# EasyEDA Pro project Arctos.eprj, board PCB1
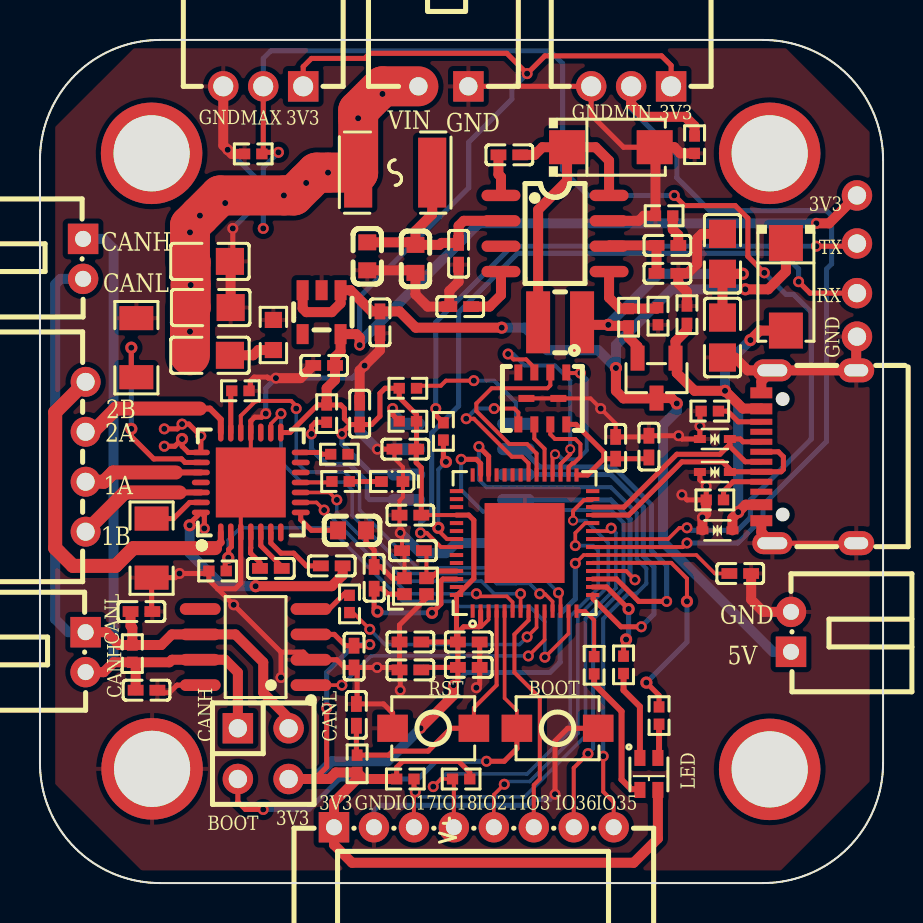
[diagram p1: board, top side]
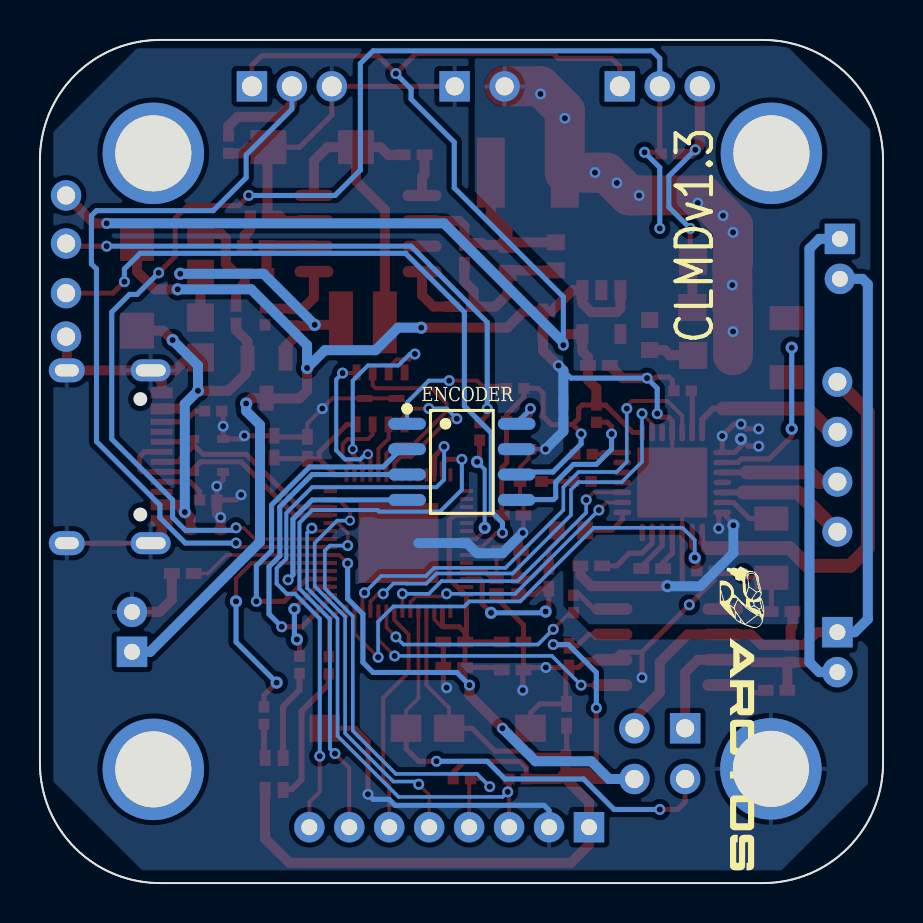
[diagram p2: board, bottom side, seen from below]

Outline 42.2 x 42.2 mm; copper layers: Top Layer, Bottom Layer. Coordinates in mm from the lower left corner of the outline.
Outline path: 0,36.2 0,36.3 0,36.39 0.01,36.49 0.01,36.59 0.02,36.68 0.03,36.78 0.04,36.88 0.05,36.97 0.06,37.07 0.08,37.16 0.09,37.26 0.11,37.35 0.13,37.45 0.15,37.54 0.17,37.63 0.2,37.73 0.22,37.82 0.25,37.91 0.28,38 0.31,38.09 0.34,38.18 0.37,38.27 0.4,38.36 0.44,38.45 0.48,38.54 0.51,38.63 0.55,38.71 0.59,38.8 0.64,38.89 0.68,38.97 0.72,39.06 0.77,39.14 0.82,39.22 0.87,39.31 0.92,39.39 0.97,39.47 1.02,39.55 1.08,39.63 1.13,39.71 1.19,39.78 1.25,39.86 1.31,39.94 1.37,40.01 1.43,40.09 1.49,40.16 1.56,40.23 1.62,40.3 1.69,40.37 1.76,40.44 1.83,40.51 1.9,40.58 1.97,40.64 2.04,40.71 2.11,40.77 2.19,40.83 2.26,40.89 2.34,40.95 2.42,41.01 2.49,41.07 2.57,41.12 2.65,41.18 2.73,41.23 2.81,41.28 2.89,41.33 2.98,41.38 3.06,41.43 3.14,41.48 3.23,41.52 3.31,41.56 3.4,41.61 3.49,41.65 3.57,41.69 3.66,41.72 3.75,41.76 3.84,41.8 3.93,41.83 4.02,41.86 4.11,41.89 4.2,41.92 4.29,41.95 4.38,41.98 4.47,42 4.57,42.03 4.66,42.05 4.75,42.07 4.85,42.09 4.94,42.11 5.04,42.12 5.13,42.14 5.23,42.15 5.32,42.16 5.42,42.17 5.52,42.18 5.61,42.19 5.71,42.19 5.81,42.2 5.9,42.2 6,42.2 36.2,42.2 36.3,42.2 36.39,42.2 36.49,42.19 36.59,42.19 36.68,42.18 36.78,42.17 36.88,42.16 36.97,42.15 37.07,42.14 37.16,42.12 37.26,42.11 37.35,42.09 37.45,42.07 37.54,42.05 37.63,42.03 37.73,42 37.82,41.98 37.91,41.95 38,41.92 38.09,41.89 38.18,41.86 38.27,41.83 38.36,41.8 38.45,41.76 38.54,41.72 38.63,41.69 38.71,41.65 38.8,41.61 38.89,41.56 38.97,41.52 39.06,41.48 39.14,41.43 39.22,41.38 39.31,41.33 39.39,41.28 39.47,41.23 39.55,41.18 39.63,41.12 39.71,41.07 39.78,41.01 39.86,40.95 39.94,40.89 40.01,40.83 40.09,40.77 40.16,40.71 40.23,40.64 40.3,40.58 40.37,40.51 40.44,40.44 40.51,40.37 40.58,40.3 40.64,40.23 40.71,40.16 40.77,40.09 40.83,40.01 40.89,39.94 40.95,39.86 41.01,39.78 41.07,39.71 41.12,39.63 41.18,39.55 41.23,39.47 41.28,39.39 41.33,39.31 41.38,39.22 41.43,39.14 41.48,39.06 41.52,38.97 41.56,38.89 41.61,38.8 41.65,38.71 41.69,38.63 41.72,38.54 41.76,38.45 41.8,38.36 41.83,38.27 41.86,38.18 41.89,38.09 41.92,38 41.95,37.91 41.98,37.82 42,37.73 42.03,37.63 42.05,37.54 42.07,37.45 42.09,37.35 42.11,37.26 42.12,37.16 42.14,37.07 42.15,36.97 42.16,36.88 42.17,36.78 42.18,36.68 42.19,36.59 42.19,36.49 42.2,36.39 42.2,36.3 42.2,36.2 42.2,6 42.2,5.9 42.2,5.81 42.19,5.71 42.19,5.61 42.18,5.52 42.17,5.42 42.16,5.32 42.15,5.23 42.14,5.13 42.12,5.04 42.11,4.94 42.09,4.85 42.07,4.75 42.05,4.66 42.03,4.57 42,4.47 41.98,4.38 41.95,4.29 41.92,4.2 41.89,4.11 41.86,4.02 41.83,3.93 41.8,3.84 41.76,3.75 41.72,3.66 41.69,3.57 41.65,3.48 41.61,3.4 41.56,3.31 41.52,3.23 41.48,3.14 41.43,3.06 41.38,2.98 41.33,2.89 41.28,2.81 41.23,2.73 41.18,2.65 41.12,2.57 41.07,2.49 41.01,2.42 40.95,2.34 40.89,2.26 40.83,2.19 40.77,2.11 40.71,2.04 40.64,1.97 40.58,1.9 40.51,1.83 40.44,1.76 40.37,1.69 40.3,1.62 40.23,1.56 40.16,1.49 40.09,1.43 40.01,1.37 39.94,1.31 39.86,1.25 39.78,1.19 39.71,1.13 39.63,1.08 39.55,1.02 39.47,0.97 39.39,0.92 39.31,0.87 39.22,0.82 39.14,0.77 39.06,0.72 38.97,0.68 38.89,0.64 38.8,0.59 38.71,0.55 38.63,0.51 38.54,0.48 38.45,0.44 38.36,0.4 38.27,0.37 38.18,0.34 38.09,0.31 38,0.28 37.91,0.25 37.82,0.22 37.73,0.2 37.63,0.17 37.54,0.15 37.45,0.13 37.35,0.11 37.26,0.09 37.16,0.08 37.07,0.06 36.97,0.05 36.88,0.04 36.78,0.03 36.68,0.02 36.59,0.01 36.49,0.01 36.39,0 36.3,0 36.2,0 6,0 5.9,0 5.81,0 5.71,0.01 5.61,0.01 5.52,0.02 5.42,0.03 5.32,0.04 5.23,0.05 5.13,0.06 5.04,0.08 4.94,0.09 4.85,0.11 4.75,0.13 4.66,0.15 4.57,0.17 4.47,0.2 4.38,0.22 4.29,0.25 4.2,0.28 4.11,0.31 4.02,0.34 3.93,0.37 3.84,0.4 3.75,0.44 3.66,0.48 3.57,0.51 3.49,0.55 3.4,0.59 3.31,0.64 3.23,0.68 3.14,0.72 3.06,0.77 2.98,0.82 2.89,0.87 2.81,0.92 2.73,0.97 2.65,1.02 2.57,1.08 2.49,1.13 2.42,1.19 2.34,1.25 2.26,1.31 2.19,1.37 2.11,1.43 2.04,1.49 1.97,1.56 1.9,1.62 1.83,1.69 1.76,1.76 1.69,1.83 1.62,1.9 1.56,1.97 1.49,2.04 1.43,2.11 1.37,2.19 1.31,2.26 1.25,2.34 1.19,2.42 1.13,2.49 1.08,2.57 1.02,2.65 0.97,2.73 0.92,2.81 0.87,2.89 0.82,2.98 0.77,3.06 0.72,3.14 0.68,3.23 0.64,3.31 0.59,3.4 0.55,3.48 0.51,3.57 0.48,3.66 0.44,3.75 0.4,3.84 0.37,3.93 0.34,4.02 0.31,4.11 0.28,4.2 0.25,4.29 0.22,4.38 0.2,4.47 0.17,4.57 0.15,4.66 0.13,4.75 0.11,4.85 0.09,4.94 0.08,5.04 0.06,5.13 0.05,5.23 0.04,5.32 0.03,5.42 0.02,5.52 0.01,5.61 0.01,5.71 0,5.81 0,5.9 0,6 0,36.2
Stack: Top Layer 0.035mm / Dielectric1 1.51mm FR4 er 4.5 / Bottom Layer 0.035mm

## Design rules (mm)
template: Custom Config
spacing copperThickness1oz (default): track to track 0.102, other pairs 0.152 to 0.3
spacing copperThickness2oz: track to track 0.203, other pairs 0.152 to 0.3
track width copperThickness1oz (default): min 0.127, default 0.254, max 2.54
track width copperThickness2oz: min 1.2, default 1.27, max 1.3
differential pair differentialPair (default): width min 0.127, default 0.254, max 2.54; gap min 0.152, default 0.152
via viaSize (default): diameter min 0.5, default 0.55, max 10; hole min 0.3, default 0.305, max 6.3
net CANL uses copperThickness2oz
net CANH uses copperThickness2oz
net +3.3V uses copperThickness2oz
net GND uses copperThickness2oz
net +24V uses copperThickness2oz
net 1B uses copperThickness2oz
net 1A uses copperThickness2oz
net 2A uses copperThickness2oz
net 2B uses copperThickness2oz
net +5V uses copperThickness2oz
net $1N9271 uses copperThickness2oz
net J_MIN uses copperThickness2oz
net J_MAX uses copperThickness2oz
net BOOT uses copperThickness2oz

## Placement (name value [footprint] x y rotation side)
C1  100nF  [C0402]  23.49 36.45 0 top
C2  33uF  [C0805]  34.16 31.5 270 top
C3  33uF  [C0805]  34.16 27.31 90 top
C4  4.7uF  [C0603]  16.38 31.37 270 top
C5  4.7uF  [C0603]  18.8 31.24 270 top
C6  10nF  [C0402]  20.95 31.5 90 top
C7  10nF  [C0402]  21.03 28.85 0 top
C8  1nF  [C0402]  31.41 31.91 180 top
C9  47pF  [C0402]  31.41 30.52 180 top
C10  1uF  [C0402]  17.02 28.07 90 top
C11  1uF  [C0402]  18.29 21.72 0 top
C12  30pF  [C0402]  5.08 13.59 180 top
C13  30pF  [C0402]  5.33 9.65 180 top
C14  100nF  [C0402]  15.72 11.34 90 top
C15  100nF  [C0402]  14.6 15.88 180 top
C16  10uF  [C0402]  18.54 18.42 0 top
C17  1uF  [C0805]  8.51 26.42 180 top
C18  1uF  [C0402]  35.05 15.49 180 top
C19  100nF  [C0402]  18.54 10.67 0 top
C20  100nF  [C0402]  18.54 12.06 0 top
C21  10uF  [C0805]  8.54 28.81 180 top
C22  10uF  [C0805]  8.51 31.12 180 top
C23  22nF  [C0402]  11.56 15.75 180 top
C24  12pF  [C0402]  16.73 15.28 270 top
C25  12pF  [C0402]  18.67 16.64 0 top
C26  1uF  [C0402]  16 23.5 270 top
C27  1uF  [C0402]  21.46 10.8 180 top
C28  100nF  [C0402]  21.46 12.06 180 top
C29  4.7uF  [C0603]  15.62 17.65 0 top
C30  1uF  [C0402]  28.82 21.78 270 top
C31  100nF  [C0402]  30.48 21.84 270 top
C32  100nF  [C0402]  14.22 25.91 0 top
C33  100nF  [C0402]  15.84 8.42 270 top
CN1  JS20T-S03PHW-00  [CONN-TH_3P-P2.00_HC-PH-3AW-G]  29.59 39.88 180 top
CN2  JS20T-S03PHW-00  [CONN-TH_3P-P2.00_HC-PH-3AW-G]  11.18 39.88 180 top
D1  B340A-13-F  [SMA_L4.4-W2.6-LS5.0-RD]  28.57 36.83 0 top
D2  B340A-13-F  [SMA_L4.4-W2.6-LS5.0-RD]  37.34 29.84 270 top
F1  BSMD1812-200-30V  [F1812]  17.78 35.56 0 top
L1  6.8uH  [IND-SMD_L3.0-W3.0_FTC303020D]  26.03 28.07 0 top
LED1  19-237/R6GHBHC-A07/2T  [LED-ARRAY-SMD_4P-L1.6-W1.6-BL-CW]  30.48 5.46 270 top
NOREF  -  [Pad_e36902]  5.61 5.72 0 top
NOREF#2  -  [Pad_e36899]  36.52 36.53 0 top
NOREF#3  -  [Pad_e36903]  36.52 5.69 0 top
NOREF#4  -  [Pad_e168]  40.89 32.01 0 top
NOREF#5  -  [Pad_e36901]  5.59 36.53 0 top
NOREF#6  -  [Pad_e170]  40.89 27.35 0 top
NOREF#7  -  [Pad_e167]  40.89 34.42 0 top
NOREF#8  -  [Pad_e169]  40.89 29.53 0 top
P1  2.54-2*2P针  [HDR-TH_4P-P2.54-V-M-R2-C2-S2.54-1]  11.18 6.48 270 top
Q1  DMG2305UX-7  [SOT-23-3_L2.9-W1.3-P1.90-LS2.4-BR]  30.86 25.27 90 top
R1  10kΩ  [R0402]  29.46 28.32 270 top
R2  1.91kΩ  [R0402]  30.94 28.37 90 top
R3  100kΩ  [R0402]  32.38 28.45 270 top
R4  5.1kΩ  [R0402]  33.53 23.62 0 top
R5  5.1kΩ  [R0402]  33.78 19.18 0 top
R6  29.4kΩ  [R0402]  31.24 33.4 0 top
R7  330Ω  [R0402]  29.21 10.92 90 top
R8  120Ω  [R0402]  4.62 11.48 270 top
R9  10kΩ  [R0402]  18.29 5.21 180 top
R10  10kΩ  [R0402]  21.08 5.21 0 top
R11  330Ω  [R0402]  27.74 10.9 90 top
R12  4.7kΩ  [R0402]  15.49 13.97 90 top
R13  330Ω  [R0402]  30.99 8.38 90 top
R14  100kΩ  [R0402]  8.89 15.62 180 top
R15  1.1Ω  [R0603]  11.68 27.43 270 top
R16  499Ω  [R0402]  20.19 22.61 90 top
R17  4.7kΩ  [R0402]  18.41 24.77 180 top
R18  4.7kΩ  [R0402]  18.41 23.11 0 top
R19  4.7kΩ  [R0402]  14.35 23.5 90 top
R20  1kΩ  [R0402]  14.99 21.46 180 top
R21  330Ω  [R0402]  15.05 20.1 180 top
R22  120mΩ  [R1206]  5.59 16.76 90 top
R23  120mΩ  [R1206]  4.83 26.8 270 top
R24  100kΩ  [R0402]  10.03 24.64 180 top
R25  10kΩ  [R0402]  15.87 5.97 270 top
R26  10kΩ  [R0402]  32.77 36.96 90 top
R27  10kΩ  [R0402]  10.67 36.5 0 top
SW1  HX 3x4x2-2P-2.5N  [SW-SMD_L4.0-W2.9-LS5.0]  25.91 7.75 0 top
SW2  HX 3x4x2-2P-2.5N  [SW-SMD_L4.0-W2.9-LS5.0]  19.68 7.75 180 top
U1  TPS54331DR  [SOIC-8_L5.0-W4.0-P1.27-LS6.0-BL]  25.78 32.51 270 top
U2  BX-XH2.54-2PWZ  [CONN-TH_2P-P2.50_BX-XH2.54-2PWZ]  20.19 39.88 180 top
U3  LESD5Z5.0CT1G  [SOD-523_L1.2-W0.8-LS1.6-BI]  33.78 20.57 0 top
U4  LESD5Z5.0CT1G  [SOD-523_L1.2-W0.8-LS1.6-BI]  33.78 22.23 0 top
U5  LESD5Z5.0CT1G  [SOD-523_L1.2-W0.8-LS1.6-BI]  33.91 17.65 0 top
U6  TLV75733PDBVR  [SOT-23-5_L2.9-W1.6-P0.95-LS2.8-BL]  14.1 28.58 180 top
U7  TJA1050T-JSM  [SOIC-8_L4.9-W3.9-P1.27-LS6.0-BL]  10.79 11.81 90 top
U8  JS20T-S02PHW-00  [CONN-TH_JS20T-S02PHW-00]  2.16 31.24 270 top
U9  JS20T-S02PHW-00  [CONN-TH_JS20T-S02PHW-00]  2.29 11.56 270 top
U10  JS20T-S08PHW-00  [CONN-TH_8P-P2.00_JS20T-S08PHW]  21.72 2.79 0 top
U11  ESP32-S3R8  [QFN-56_L7.0-W7.0-P0.40-TL-EP4.0]  24.26 17.02 90 top
U12  TMC2209-LA-T  [QFN-28_L5.0-W5.0-P0.50-BL-EP]  10.55 20.05 0 top
U13  TLE5012BE1000  [PG-DSO-8_L5.0-W4.0-P1.27-LS6.0-BL]  21.08 21.08 270 bottom
U14  XL-1005UWC  [LED0402-RD_YELLOW]  17.63 20.1 180 top
U15  W25Q16JVUUIQ  [USON-8_L4.0-W3.0-P0.80-BL_AT25SL321]  25.15 24.26 180 top
U16  XY-XHB2.54-4A21  [HDR-TH_4P-P2.50-H-F-W7.3-N]  2.29 21.34 270 top
U17  JS20T-S02PHW-00  [CONN-TH_JS20T-S02PHW-00]  37.59 12.57 90 top
USB1  TYPE-C 16PIN 2MD(073)  [USB-C-SMD_TYPE-C-6PIN-2MD-073]  38.48 21.34 90 top
X1  40MHz  [CRYSTAL-SMD_4P-L1.6-W1.2-BL]  18.8 14.86 0 top

## Footprints (pads in the part's own frame, mm; a bottom-side part is the same pattern mirrored in y, then rotated)
C0402
  rect 0.79x0.54 smd: 1(-0.545,0) 2(0.545,0)
C0603
  rect 0.8x0.9 smd: 1(-0.7,0) 2(0.7,0)
C0805
  rect 1.41x1.35 smd: 1(-1,0) 2(1,0)
CONN-TH_2P-P2.50_BX-XH2.54-2PWZ
  rect 1.524x1.524 hole 0.914: 1(-1.25,0)
  round 1.524 hole 0.914: 2(1.25,0)
CONN-TH_3P-P2.00_HC-PH-3AW-G
  rect 1.524x1.524 hole 1: 1(-2,0)
  round 1.524 hole 1: 2(0,0) 3(2,0)
CONN-TH_8P-P2.00_JS20T-S08PHW
  rect 1.524x1.524 hole 0.8: 1(-7,0)
  round 1.524 hole 0.8: 2(-5,0) 3(-3,0) 4(-1,0) 5(1,0) 6(3,0) 7(5,0) 8(7,0)
CONN-TH_JS20T-S02PHW-00
  rect 1.524x1.524 hole 0.8: 1(-1,0)
  round 1.524 hole 0.8: 2(1,0)
CRYSTAL-SMD_4P-L1.6-W1.2-BL
  rect 0.73x0.6 smd: 1(-0.55,-0.4) 2(0.55,-0.4) 3(0.55,0.4) 4(-0.55,0.4)
F1812
  rect 1.407x3.499 smd: 1(-1.853,0) 2(1.853,0)
HDR-TH_4P-P2.50-H-F-W7.3-N
  round 1.5 hole 0.9: 1(-3.75,0) 2(-1.25,0) 3(1.25,0) 4(3.75,0)
HDR-TH_4P-P2.54-V-M-R2-C2-S2.54-1
  rect 1.524x1.524 hole 0.914: 1(-1.27,-1.27)
  round 1.524 hole 0.914: 2(-1.27,1.27) 3(1.27,-1.27) 4(1.27,1.27)
IND-SMD_L3.0-W3.0_FTC303020D
  rect 1.2x3.1 smd: 1(-1.1,0) 2(1.1,0)
LED0402-RD_YELLOW
  rect 0.636x0.54 smd: 1(-0.538,0) 2(0.538,0)
LED-ARRAY-SMD_4P-L1.6-W1.6-BL-CW
  rect 0.8x0.55 smd: 1(-0.8,-0.45) 2(0.8,-0.45) 3(-0.8,0.45) 4(0.8,0.45)
Pad_e167
  round 1.524 hole 0.914: 1(0,0)
Pad_e168
  round 1.524 hole 0.914: 2(0,0)
Pad_e169
  round 1.524 hole 0.914: 3(0,0)
Pad_e170
  round 1.524 hole 0.914: 4(0,0)
Pad_e36899
  round 5.08 hole 3.81: 1(0,0)
Pad_e36901
  round 5.08 hole 3.81: 1(0,0)
Pad_e36902
  round 5.08 hole 3.81: 1(0,0)
Pad_e36903
  round 5.08 hole 3.81: 1(0,0)
PG-DSO-8_L5.0-W4.0-P1.27-LS6.0-BL
  oval 0.602x1.885 smd: 1(-1.905,-2.743) 2(-0.635,-2.743) 3(0.635,-2.743) 4(1.905,-2.743) 5(1.905,2.743) 6(0.635,2.743) 7(-0.635,2.743) 8(-1.905,2.743)
QFN-28_L5.0-W5.0-P0.50-BL-EP
  oval 0.28x0.9 smd: 1(-1.502,-2.5) 2(-1.001,-2.5) 3(-0.5,-2.5) 4(0,-2.5) 5(0.5,-2.5) 6(1,-2.5) 7(1.501,-2.5) 15(1.501,2.5) 16(1,2.5) 17(0.5,2.5) 18(0,2.5) 19(-0.5,2.5) 20(-1.001,2.5) 21(-1.502,2.5)
  oval 0.9x0.28 smd: 8(2.5,-1.502) 9(2.5,-1.001) 10(2.5,-0.5) 11(2.5,0) 12(2.5,0.5) 13(2.5,1) 14(2.5,1.501) 22(-2.5,1.501) 23(-2.5,1) 24(-2.5,0.5) 25(-2.5,0) 26(-2.5,-0.5) 27(-2.5,-1.001) 28(-2.5,-1.502)
  rect 3.5x3.5 smd: 29(0,0)
QFN-56_L7.0-W7.0-P0.40-TL-EP4.0
  rect 0.665x0.2 smd: 1(-3.408,2.6) 2(-3.408,2.2) 3(-3.408,1.8) 4(-3.408,1.4) 5(-3.408,1) 6(-3.408,0.6) 7(-3.408,0.2) 8(-3.408,-0.2) 9(-3.408,-0.6) 10(-3.408,-1) 11(-3.408,-1.4) 12(-3.408,-1.8) 13(-3.408,-2.2) 14(-3.408,-2.6) 29(3.408,-2.6) 30(3.408,-2.2) 31(3.408,-1.8) 32(3.408,-1.4) 33(3.408,-1) 34(3.408,-0.6) 35(3.408,-0.2) 36(3.408,0.2) 37(3.408,0.6) 38(3.408,1) 39(3.408,1.4) 40(3.408,1.8) 41(3.408,2.2) 42(3.408,2.6)
  rect 0.2x0.665 smd: 15(-2.6,-3.408) 16(-2.2,-3.408) 17(-1.8,-3.408) 18(-1.4,-3.408) 19(-1,-3.408) 20(-0.6,-3.408) 21(-0.2,-3.408) 22(0.2,-3.408) 23(0.6,-3.408) 24(1,-3.408) 25(1.4,-3.408) 26(1.8,-3.408) 27(2.2,-3.408) 28(2.6,-3.408) 43(2.6,3.408) 44(2.2,3.408) 45(1.8,3.408) 46(1.4,3.408) 47(1,3.408) 48(0.6,3.408) 49(0.2,3.408) 50(-0.2,3.408) 51(-0.6,3.408) 52(-1,3.408) 53(-1.4,3.408) 54(-1.8,3.408) 55(-2.2,3.408) 56(-2.6,3.408)
  rect 4x4 smd: 57(0,0)
R0402
  rect 0.566x0.54 smd: 1(-0.433,0) 2(0.433,0)
R0603
  rect 0.806x0.864 smd: 1(-0.753,0) 2(0.753,0)
R1206
  rect 1.208x1.701 smd: 1(-1.479,0) 2(1.479,0)
SMA_L4.4-W2.6-LS5.0-RD
  rect 1.8x1.7 smd: 1(-2.192,0) 2(2.192,0)
SOD-523_L1.2-W0.8-LS1.6-BI
  rect 0.6x0.4 smd: 1(-0.75,0) 2(0.75,0)
SOIC-8_L4.9-W3.9-P1.27-LS6.0-BL
  oval 0.588x2.045 smd: 1(-1.905,-2.772) 2(-0.635,-2.772) 3(0.635,-2.772) 4(1.905,-2.772) 5(1.905,2.772) 6(0.635,2.772) 7(-0.635,2.772) 8(-1.905,2.772)
SOIC-8_L5.0-W4.0-P1.27-LS6.0-BL
  oval 0.569x1.95 smd: 1(-1.905,-2.705) 2(-0.635,-2.705) 3(0.635,-2.705) 4(1.905,-2.705) 5(1.905,2.705) 6(0.635,2.705) 7(-0.635,2.705) 8(-1.905,2.705)
SOT-23-3_L2.9-W1.3-P1.90-LS2.4-BR
  rect 1.25x0.7 smd: 1(1,-0.95) 2(1,0.95) 3(-1,0)
SOT-23-5_L2.9-W1.6-P0.95-LS2.8-BL
  rect 0.6x1 smd: 1(-0.95,-1.1) 2(0,-1.1) 3(0.95,-1.1) 4(0.95,1.1) 5(-0.95,1.1)
SW-SMD_L4.0-W2.9-LS5.0
  rect 1.53x1.36 smd: 1(-2.035,0) 2(2.035,0)
USB-C-SMD_TYPE-C-6PIN-2MD-073
  rect 0.55x1.1 smd: 1(-3.2,2.375) 2(-2.4,2.375) 11(2.4,2.375) 12(3.2,2.375)
  rect 0.3x1.1 smd: 3(-1.75,2.375) 4(-1.25,2.375) 5(-0.75,2.375) 6(-0.25,2.375) 7(0.25,2.375) 8(0.75,2.375) 9(1.25,2.375) 10(1.75,2.375)
  oval 1.1x2 hole 0.6x1.5: 13(-4.325,1.825) 14(4.325,1.825)
  oval 1.2x1.8 hole 0.6x1.2: 13(-4.325,-2.375) 14(4.325,-2.375)
USON-8_L4.0-W3.0-P0.80-BL_AT25SL321
  rect 0.4x0.8 smd: 1(-1.2,-1.3) 2(-0.4,-1.3) 3(0.4,-1.3) 4(1.2,-1.3) 5(1.2,1.3) 6(0.4,1.3) 7(-0.4,1.3) 8(-1.2,1.3)
  rect 0.8x0.35 smd: 9(-0.802,0) 10(0.798,0)

## Nets
As in the schematic, except:
+3.3V: C11.2 C14.2 C16.2 C18.2 C19.2 C20.2 C26.2 C27.2 C28.2 C32.2 CN1.1 CN2.1 LED1.4 NOREF#7.1 P1.4 R9.2 R10.2 R17.2 R18.2 R19.2 R25.2 U6.5 U7.3 U10.1 U11.2 U11.3 U11.20 U11.46 U11.55 U11.56 U12.15 U13.6
GND: C2.1 C3.1 C4.2 C5.2 C6.1 C7.1 C9.1 C10.1 C11.1 C12.1 C13.1 C14.1 C16.1 C18.1 C19.1 C20.1 C21.1 C22.1 C24.1 C25.1 C26.1 C27.1 C28.1 C29.2 C30.1 C31.1 C32.1 C33.1 CN1.3 CN2.3 D1.2 NOREF.1 NOREF#6.4 R2.1 R3.1 R4.1 R5.1 R6.1 R14.2 R15.1 R22.1 R23.1 R24.1 R26.1 R27.1 SW1.2 SW2.2 U1.7 U2.1 U3.1 U4.1 U5.1 U6.2 U7.2 U7.8 U10.2 U11.57 U12.3 U12.18 U12.29 U13.7 U14.1 U15.4 U15.9 U15.10 U17.2 USB1.1 USB1.12 USB1.13 USB1.14 X1.2 X1.4
U0RXD: NOREF#8.3 U11.50
U0TXD: NOREF#4.2 R16.2

Pads without a net: NOREF#2 1; NOREF#5 1; U1 3; U6 4; U7 5; U11 1 28 36 37 42 43 44 45 47 48 51 52; U12 17 25; USB1 3 9

## Via types
v1: diameter 0.55, hole 0.305, Top Layer to Bottom Layer, 88 vias
v2: diameter 0.61, hole 0.305, Top Layer to Bottom Layer, 23 vias
v3: diameter 0.5, hole 0.305, Top Layer to Bottom Layer, 3 vias

## Routing (per net, layer and track width the routed paths; a pad name or vN(x,y) marks a point on that pad's centre or on a via; arc(x,y) is an arc through that point)
5V_OUT: length 2.4
  Top Layer w0.254: C29.1 13.59,17.65 13.05,18.19 U12.8
+3.3V: length 186.6
  Top Layer w0.18: C18.2 33.78,15.49 32.86,16.42 U11.20 27.21,16.42 v1(26.8,16) ; 21.97,12.83 22.1,12.83 22.46,13.19 U11.3
  Top Layer w0.2: U11.46 19.09,18.42 C16.2
  Top Layer w0.254: U11.46 21.46,18.42 21.72,18.16 21.72,15.24 20.89,14.42 U11.56 20.85,12.13 C28.2 ; C28.2 C27.2 ; C28.2 C20.2 ; C28.2 20.92,12.54 21.21,12.83 21.97,12.83 22.06,12.91 22.06,13.61 ; R9.2 17.85,5.79 18.16,6.1 20.95,6.1 21.51,5.54 R10.2 ; 15.53,22.95 15.11,22.53 v1(15.11,22.48) ; 15.53,22.95 C26.2 16.6,22.95 17.02,23.37 17.02,24.51 17.27,24.77 R17.2 17.98,24.31 18.85,23.44 R18.2 18.85,21.73 C11.2 18.83,21.05 19.09,20.79 C16.2 ; 15.53,22.95 15.24,23.24 15.24,23.75 15.06,23.93 R19.2 13.89,23.93 12.52,22.55 U12.15 ; C27.2 19.21,10.8 C19.2 ; C27.2 20.92,10.12 v1(20.7,9.91) ; U7.3 14.73,12.45 15.3,11.88 C14.2 16.45,11.88 v1(16.51,11.94) ; CN1.1 31.59,40.93 31.11,41.4 25.27,41.4 v1(24.38,40.51) 23.37,41.53 16.51,41.53 16.26,41.28 13.59,41.28 13.18,40.86 CN2.1 ; 13.75,5.21 14.35,5.81 v1(14.35,8.76)
  Top Layer w0.5: R25.2 15.87,5.21 14.72,4.05 U10.1 14.72,1.92 15.62,1.02 29.72,1.02 30.93,2.23 LED1.4 ; R25.2 16.2,5.21 R9.2 ; R25.2 14.81,5.54 14.48,5.21 P1.4 ; v1(38.86,33.02) 39.5,33.02 NOREF#7.1 ; v1(20.7,9.91) 20.7,9.4 v1(19.05,7.75) ; v1(16,26.92) 16,27.31 15.83,27.48 15.05,27.48 15.05,26.6 14.77,26.33 C32.2 14.77,25.18 14.35,24.77 R19.2
  Bottom Layer w0.254: v1(20.7,9.91) 21.34,10.54 25.53,10.54 26.03,11.05 26.03,13.46 26.8,14.22 v1(26.8,16) ; 16,27.05 16,29.34 21.46,34.8 21.46,37.08 23.62,39.24 23.62,39.75 v1(24.38,40.51) ; v1(15.11,22.48) 15.11,21.98 16.52,20.57 18.25,20.57 18.36,20.46 ; v1(14.35,8.76) 14.35,10.54 15.75,11.94 v1(16.51,11.94)
  Bottom Layer w0.5: v1(19.05,7.75) 17.4,6.1 14.6,6.1 13.72,5.21 P1.4 ; v1(38.86,33.02) 21.97,33.02 16,27.05
+5V: length 52.1
  Top Layer w0.5: D2.1 37.34,30.61 36.45,29.72 v2(35.31,29.72) ; v2(23.11,27.8) 18.81,27.8 18,28.61 C10.2 16.6,28.61 15.54,29.67 15.05,29.67 15.05,29.02 14.6,28.58 13.33,28.58 13.15,28.76 U6.3 ; v2(28.83,25.78) 28.83,24.64 29.21,24.26 30.84,24.26 Q1.3 31.61,24.27 v2(31.88,24)
  Bottom Layer w0.5: v2(35.31,29.72) 31.62,29.72 28.83,26.92 v2(28.83,25.78) 27.94,26.67 25.4,26.67 24.27,27.8 v2(23.11,27.8) ; v2(31.88,24) 31.88,23.62 31.19,22.93 31.19,17.07 36.69,11.57 U17.1
+24V: length 40.3
  Top Layer w0.254: v1(6.22,22.73) 6.87,22.73 v1(7.11,22.97) 7.46,22.97 v1(8.05,22.37) U12.22 7.43,21.55 7.11,21.87 v2(7.11,22.23) 6.75,21.86 v1(6.22,21.86) ; v2(7.49,17.91) 7.49,17.99 U12.28 8.23,18.37 v1(8.23,17.75)
  Top Layer w0.5: v2(10.79,14.86) 14.6,14.86 15.15,15.4 C15.1
  Top Layer w2: C17.2 v1(7.51,27.6) 7.51,28.77 C21.2 v1(7.54,29.93) 7.54,31.08 C22.2 v1(7.51,32.57) 7.51,32.91 v1(8.01,33.41) 9.02,34.42 v1(12.21,34.42) 12.7,34.42 v1(13.32,35.04) 13.84,35.56 v1(14.42,35.56) F1.1 v1(15.93,38.28) 15.93,38.66 17.14,39.88 U2.2
  Bottom Layer w0.5: v2(7.49,17.91) 7.49,16.51 9.14,14.86 v2(10.79,14.86)
  vias: v1(9.27,34.04) v1(17.14,39.5)
GND: length 176.2
  Top Layer w0.2: U15.10 U15.9 27.56,24.26 v1(28.07,23.75) 28.82,23 C30.1 ; U12.18 U12.29 10.05,19.55 U12.3 ; C11.1 17.74,21.25 18.17,20.82 U14.1 18.17,19.31 18,19.14 18,17.82 18.12,17.69 C25.1 18.25,16.52 X1.4
  Top Layer w0.254: v1(18.03,17.53) 18.03,17.6 18.12,17.69 ; C29.2 16.32,17.08 16.73,16.67 C24.1 17.07,15.82 17.63,15.26 X1.4 ; C28.1 C27.1 22.01,9.94 v1(21.84,9.78) ; U3.1 33.03,20.18 v1(33.35,19.86) R5.1 32.38,19.18 v1(32.13,19.43) ; C14.1 15.24,10.79 14.86,11.18 U7.2 13.19,11.56 12.06,11.56 ; C14.1 v1(16.88,10.79) 17.87,10.79 18,10.67 ; C14.1 15.87,10.64 15.87,9 C33.1 17.2,8.96 17.65,8.51 SW2.2 ; U2.1 CN1.3 27.59,38.45 29.21,36.83 D1.2 ; v1(9.65,32.77) 9.65,31.26 C22.1 ; 18,10.67 18,12.92 19.35,14.27 X1.2 ; 18,10.67 18.03,10.63 v1(18.03,9.65) ; U12.3 10.05,15 9.78,14.73 8.89,14.73 ; 5.62,9.53 6.48,9.53 6.86,9.91 U7.8 ; 8.89,14.73 8.46,15.17 R14.2 8.33,15.49 v1(6.98,15.49) 6.78,15.28 R22.1 5.59,13.68 5.37,13.46 ; 8.89,14.73 v1(9.7,13.93) 12.06,11.56 ; v1(11.3,23.5) 11.28,23.5 11.1,23.32 10.75,23.32 10.55,23.13 U12.18 ; v1(12.06,10.29) 12.06,11.56 ; C11.1 v1(16.89,21.72) ; v1(25.78,4.45) 25.78,7.11 26.42,7.75 SW1.2 ; R4.1 33.03,23.56 v1(33.03,22.87) U4.1 32.13,22.23 v1(31.97,22.39) 30.48,22.39 30.42,22.33 C30.1 ; v1(11.81,25.27) 11.43,25.27 11.38,25.33 10.72,25.33 10.54,25.15 10.54,24.71 R24.1 ; USB1.13 USB1.13
  Top Layer w0.5: USB1.14 USB1.14 40.86,27.31 NOREF#6.4 ; USB1.14 36.11,25.11 USB1.12 ; USB1.14 35.43,25.66 34.78,26.31 C3.1 ; R5.1 33.35,18.49 v1(33.16,18.3) U5.1 ; C21.1 9.54,31.08 C22.1 ; R27.1 9.6,36.5 v1(9.4,36.7) 9.18,36.92 CN2.3 ; U17.2 36.21,13.57 35.6,14.19 C18.1 ; C10.1 17.02,26.67 v1(16.25,25.9) 16,25.65 C26.1 ; USB1.1 36.11,17.56 USB1.13 ; R26.1 32.06,36.52 31.75,36.83 D1.2 30.81,36.79 R6.1 30.23,33.4 29.97,33.15 U1.7 ; C32.1 13.04,25.27 v1(11.81,25.27) ; C4.2 18.67,30.67 C5.2 18.8,29.46 19.41,28.85 C7.1 20.49,29.63 20.95,30.1 C6.1 ; 32.38,28.88 32.38,29.59 31.95,30.03 C9.1 32.42,30.52 32.89,30.99 32.89,32.26 33.13,32.5 C2.1
  Bottom Layer w0.254: v1(25.78,4.45) 25.53,4.19 24.72,4.19 24.42,3.89 16.97,3.89 16.72,3.64 U10.2 ; v1(11.3,23.5) 11.3,24.77 v1(11.81,25.27) 15.62,25.27 16,25.65 ; v1(9.4,36.7) 10.72,35.38 10.72,33.83 v1(9.65,32.77)
  Bottom Layer w0.5: 23.26,17.02 20.83,17.02 20.32,16.51 19.05,16.51 v1(18.03,17.53) ; v1(16.25,25.9) 16,25.65 16,22.61 v1(16.89,21.72)
VBUS: length 21.5
  Top Layer w0.5: D2.2 36.03,27.65 v2(35.56,27.18) ; USB1.2 35.32,18.94 v2(34.95,18.57) 34.66,18.28 U5.2 ; R3.2 32.38,27.69 31.81,27.11 Q1.1 31.88,26.21 31.88,25.53 32.77,24.64 v2(34.29,24.64) 35.18,23.75 36.09,23.75 USB1.11
  Bottom Layer w0.5: v2(35.56,27.18) 34.29,25.91 v2(34.29,24.64) 34.95,23.98 v2(34.95,18.57)
VCC_5V: length 15.1
  Top Layer w0.5: v2(35.18,30.5) C2.2 C3.2 ; 27.13,27.94 v2(28.45,27.94) 28.5,27.89 R1.2 29.46,27.31 29.91,26.86 Q1.2
  Bottom Layer w0.5: v2(35.18,30.5) 31,30.5 v2(28.45,27.94)
VDD_SPI: length 6.8
  Top Layer w0.254: 28.22,21.24 27.41,20.43 U11.29 ; 28.22,21.24 C30.2 30.42,21.24 C31.2 ; 28.22,21.24 28.22,21.56 26.83,22.96 U15.8
VIN: length 11.7
  Top Layer w0.5: C5.1 18.8,32.64 19.63,33.48 F1.2 ; C5.1 18.67,32.07 C4.1 ; C5.1 20,31.94 20.1,32.04 20.95,32.04 20.95,32.89 21.21,33.15 U1.2
1A: length 6
  Top Layer w0.3: 6.8,20.55 U12.24
  Top Layer w0.7: U16.3 3.19,20.09 3.66,20.55 6.8,20.55
1B: length 6.6
  Top Layer w0.3: 6.99,19.55 U12.26
  Top Layer w0.7: 6.99,19.55 4.25,19.55 U16.4
2A: length 8.1
  Top Layer w0.3: U12.21 9.05,23.21 8.51,23.75 8,23.75
  Top Layer w0.7: U16.2 2.65,22.59 3.81,23.75 8,23.75
2B: length 18.6
  Top Layer w0.3: 9.05,17.05 U12.1
  Top Layer w0.4: 8.76,16.76 9.05,17.05
  Top Layer w0.7: 8.76,16.76 4.67,16.76 3.78,15.88 1.65,15.88 0.76,16.76 0.76,23.56 U16.1
BLUE_LED: length 12.6
  Top Layer w0.2: U11.19 27.67,16.03 31.6,16.03 32.38,15.24 v2(32.38,14.1)
  Top Layer w0.254: R13.2 30.99,9.4 v2(30.35,10.03)
  Bottom Layer w0.254: v2(30.35,10.03) 32.38,12.06 v2(32.38,14.1)
BOOT: length 23.7
  Top Layer w0.18: SW1.1 23.87,8.64 23.26,9.25 U11.5
  Top Layer w0.254: P1.3 9.91,4.06 10.29,3.68 v1(11.18,3.68) ; SW1.1 23.87,6.73 23.24,6.1 v1(22.35,6.1)
  Bottom Layer w0.254: v1(11.18,3.68) 13.46,3.68 14.99,5.21 18.92,5.21 19.81,6.1 v1(22.35,6.1)
BRA: length 10
  Top Layer w0.254: R23.2 4.57,25.57 v2(4.57,26.8) ; v2(4.57,22.73) 4.57,22.35 5.69,21.23 7.09,21.23 7.27,21.05 U12.23
  Bottom Layer w0.254: v2(4.57,22.73) v2(4.57,26.8)
BRB: length 2.8
  Top Layer w0.254: U12.27 7.49,19.05 6.69,18.24 5.59,18.24
CAN_RXD: length 11.2
  Top Layer w0.18: v1(16.51,12.7) 15.67,13.54 R12.1 ; v1(24.38,12.32) 24.86,12.79 U11.9
  Bottom Layer w0.18: v1(24.38,12.32) 24,11.94 17.27,11.94 v1(16.51,12.7)
CAN_TXD: length 14.1
  Top Layer w0.18: v1(15.11,9.91) U7.1 ; v1(24.45,11.37) 25.26,12.18 U11.10
  Bottom Layer w0.18: v1(24.45,11.37) 16.57,11.37 v1(15.11,9.91)
CANH: length 36.4
  Top Layer w0.5: R8.2 4.79,10.88 4.79,9.65 ; R8.2 6.48,11.05 6.6,11.18 U7.7 9.27,11.18 9.91,10.54 P1.1 ; R8.2 3.68,11.05 3.19,10.56 U9.2
  Bottom Layer w0.5: U9.2 3.19,10.56 3.68,11.05 3.68,31.75 3.19,32.24 U8.1
CANL: length 35.6
  Top Layer w0.5: 4.62,11.91 3.96,11.91 3.32,12.56 U9.1 ; 4.62,11.91 6.07,11.91 6.6,12.45 U7.6 9.78,12.45 11.18,11.05 11.18,9.53 12.45,8.25 P1.2 ; 4.62,11.91 4.62,12.78 4.53,12.86 C12.2
  Bottom Layer w0.5: U8.2 1.03,30.24 0.76,29.97 0.76,13.21 1.41,12.56 U9.1
DIAG: length 1.6
  Top Layer w0.2: U12.11 14.56,20.05 R21.2
DIR: length 24.3
  Top Layer w0.18: 26.06,13.61 26.06,14.43 v1(25.95,14.53)
  Top Layer w0.2: U12.19 10.05,23.39 10.78,24.12 10.85,24.12 10.87,24.13 12.57,24.13 12.83,23.88 v1(12.83,23.75)
  Bottom Layer w0.18: v1(12.83,23.75) 12.83,21.08 13.33,20.57 15.24,20.57 16,19.81 16,18.67 18.89,15.78 22.47,15.78 22.88,15.37 25.12,15.37 v1(25.95,14.53)
ENCODER_CS: length 16.7
  Top Layer w0.254: v1(30.1,12.83) 29.08,12.83 27.69,14.22 27.69,14.4 U11.15
  Bottom Layer w0.254: U13.3 28.57,20.45 30.2,18.83 30.2,16.37 30.73,15.83 30.73,13.46 v1(30.1,12.83)
ENCODER_DATA: length 11.6
  Top Layer w0.2: U11.18 29.34,15.62 v1(29.78,15.18)
  Bottom Layer w0.254: U13.4 28.57,19.18 29.54,18.21 29.54,15.42 v1(29.78,15.18)
ENCODER_SCK: length 17.3
  Top Layer w0.254: U11.17 28.85,15.22 29.97,14.1 v1(31.37,14.1)
  Bottom Layer w0.254: 23.82,21.72 24.13,21.72 25.02,20.83 28.7,20.83 30.61,18.92 30.61,16.64 31.37,15.88 v1(31.37,14.1)
GPIO3: length 11.8
  Top Layer w0.2: U10.6 24.72,4.91 25.02,5.21 25.02,9.27 23.75,10.54 23.75,12.45 24.46,13.15 U11.8
GPIO17: length 24.4
  Top Layer w0.18: U11.23 28.45,17.62 v1(28.59,17.76)
  Top Layer w0.2: U10.3 18.72,4.56
  Top Layer w0.254: R9.1 18.72,4.63 v1(18.79,4.56)
  Bottom Layer w0.18: v1(28.59,17.76) 28.83,17.53 28.83,14.76 27.3,13.24 27.3,7.37 24.25,4.31 19.04,4.31 v1(18.79,4.56)
GPIO18: length 24.1
  Top Layer w0.18: v1(26.8,16.89) 26.8,17.53 27.29,18.02 U11.24 ; v1(19.68,4.83) 20.07,5.21 R10.1
  Top Layer w0.2: U10.4 20.72,5.14 R10.1
  Bottom Layer w0.18: v1(19.68,4.83) 20.32,5.46 24.38,5.46 26.54,7.62 26.54,13.35 27.94,14.75 27.94,16.64 27.69,16.89 v1(26.8,16.89)
GPIO21: length 21.2
  Top Layer w0.18: v1(23.24,4.94) 22.72,4.42 U10.5
  Top Layer w0.2: U11.27 27.62,19.17 27.23,19.17 26.68,18.63 v3(26.68,18.14)
  Bottom Layer w0.18: v3(26.68,18.14) 27.32,18.14 28.45,17.02 28.45,14.86 26.92,13.34 26.92,7.49 24.51,5.08 23.38,5.08 v1(23.24,4.94)
GPIO35: length 29.1
  Top Layer w0.2: U10.8 28.72,4.05 28.19,4.57 v1(28.19,6.35)
  Top Layer w0.254: U11.40 22.46,21.36 v1(21.97,21.84)
  Bottom Layer w0.2: v1(21.97,21.84) 21.97,20.19 22.35,19.81 28.57,19.81 29.87,18.52 29.87,16.23 30.35,15.75 30.35,14.99 29.84,14.48 29.44,14.48 28.19,13.23 v1(28.19,6.35)
GPIO36: length 28.3
  Top Layer w0.2: U10.7 26.72,5.76 v1(27.43,6.48)
  Top Layer w0.254: 22.06,20.43 22.06,21 21.84,21.21 v1(21.08,21.21)
  Bottom Layer w0.2: v1(21.08,21.21) 21.08,19.69 22.18,18.59 25.22,18.59 25.3,18.67 28.57,18.67 29.21,18.03 29.21,14.73 27.69,13.21 27.69,6.73 v1(27.43,6.48)
GREEN_LED: length 2.9
  Top Layer w0.2: U11.14 27.28,13.61 27.74,13.15 R11.2
IFA: length 8.2
  Top Layer w0.254: v1(13.59,22.48) 13.59,22.86 13.79,23.06 R19.1
  Bottom Layer w0.254: 18.36,19.19 16.49,19.19 16.38,19.3 16.38,20.07 15.49,20.95 14.35,20.95 13.59,21.72 v1(13.59,22.48)
IFB: length 1.8
  Top Layer w0.254: R18.1 17.65,23.44 v1(17.65,23.75)
  Bottom Layer w0.254: 18.36,23 17.65,23.71 v1(17.65,23.75)
IFC: length 6.7
  Top Layer w0.2: R17.1 18.97,24.89 20.07,24.89 20.32,25.15 v1(21.72,25.15)
  Bottom Layer w0.2: U13.1 23.82,24.05 22.73,25.15 v1(21.72,25.15)
J_MAX: length 66.9
  Top Layer w0.18: v1(32.38,17.78) 32,17.78 31.44,17.22 U11.22
  Top Layer w0.254: 11.18,36.56 CN2.2 ; 11.18,36.56 11.19,36.58 v1(11.94,36.58) ; 11.18,36.56 R27.2 ; v1(31.75,34.42) 32.26,33.91 34.8,33.91 35.43,33.27 35.43,31.37 v1(36.26,30.54)
  Bottom Layer w0.254: v1(11.94,36.58) 11.18,35.81 v1(11.18,32.77) ; v1(32.38,17.78) 32.51,17.65 34.91,17.65 35.56,18.3 35.56,19.18 38.61,22.23 38.61,28.58 37.72,29.46 37.34,29.46 v1(36.26,30.54) ; v1(31.75,34.42) 27.43,34.42 26.16,35.69 26.16,41.02 25.53,41.66 11.56,41.66 11.18,41.28 CN2.2
J_MIN: length 44.7
  Top Layer w0.2: U11.21 32.18,16.82 v1(32.38,17.02)
  Top Layer w0.5: CN1.2 29.59,38.99 30.23,38.35 32.3,38.35 32.77,37.89 R26.2
  Bottom Layer w0.254: v1(32.38,17.02) 34.92,17.02 36.19,18.29 36.19,18.92 39.37,22.1 39.37,30.73 39.62,30.99 39.62,33.4 39.37,33.66 33.53,33.66 31.88,35.31 31.88,36.45 29.59,38.73 CN1.2
MS1: length 13.1
  Top Layer w0.18: v1(14.22,18.67) 13.84,19.05 U12.9 ; v1(21.84,14.48) 21.97,14.35 23.37,14.35 23.66,14.06 23.66,13.61
  Bottom Layer w0.18: v1(21.84,14.48) 18.41,14.48 v1(14.22,18.67)
MS2: length 14.3
  Top Layer w0.18: U12.10 14.49,19.55 v1(14.86,19.18) ; 24.06,13.61 v1(24.06,14.48)
  Bottom Layer w0.18: v1(24.06,14.48) 22.73,14.48 22.1,15.11 18.29,15.11 14.86,18.54 v1(14.86,19.18)
RED_LED: length 4.7
  Top Layer w0.254: v2(29.46,13.72) 28.36,14.82 U11.16 ; v2(29.34,12.19) 29.21,12.06 R7.2
  Bottom Layer w0.254: v2(29.34,12.19) 29.46,12.32 v2(29.46,13.72)
RESET: length 14.2
  Top Layer w0.2: U11.4 22.86,9.9 21.72,8.77 SW2.1
  Top Layer w0.254: SW2.1 20.57,7.75 19.43,6.6 17.65,6.6 17.45,6.4 R25.1 15.84,6.44 C33.2
SPICLK: length 2.7
  Top Layer w0.2: U11.33 25.26,21.73 24.75,22.24 U15.6
SPICS0: length 7.7
  Top Layer w0.2: 25.66,20.43 25.66,21.34 25.78,21.46 ; U15.1 26.38,25.53 v1(27.05,25.53)
  Bottom Layer w0.2: v1(27.05,25.53) 27.37,25.21 27.37,21.65 26.92,21.21 26.16,21.21 25.91,21.46 v3(25.78,21.46)
SPID: length 8.1
  Top Layer w0.2: U15.5 23.95,23.55 23.75,23.75 v1(22.73,23.75) ; v1(21.34,23.24) 21.72,23.24 23.62,21.34 24.13,21.34 24.46,21.01 U11.35
  Bottom Layer w0.2: v1(21.34,23.24) 21.84,23.75 v1(22.73,23.75)
SPIHD: length 4
  Top Layer w0.2: U11.30 26.46,20.81 26.65,21.01 26.72,21.01 27.05,21.34 27.05,21.97 26.8,22.23 25.78,22.23 25.55,22.46 U15.7
SPIQ: length 10.1
  Top Layer w0.2: U11.34 24.86,21.5 24.38,21.97 23.49,21.97 21.84,23.62 21.84,24 22.61,24.77 25.4,24.77 25.55,24.91 U15.2
SPIWP: length 10.4
  Top Layer w0.2: 26.06,20.43 26.06,20.98 26.54,21.46 v3(26.54,21.72) ; v1(23.43,26.48) 23.7,26.21 24.34,26.21 24.75,25.8 U15.3
  Bottom Layer w0.2: v1(23.43,26.48) 23.69,26.48 24.26,25.91 25.78,25.91 26.54,25.15 v3(26.54,21.72)
STDBY: length 2.1
  Top Layer w0.254: U12.20 9.55,24.59 R24.2
STEP: length 21.3
  Top Layer w0.18: v1(12.06,23.5) 11.56,22.99 11.56,22.55 U12.16 ; v1(25.02,14.48) 25.27,14.48 25.66,14.09 25.66,13.61
  Bottom Layer w0.18: v1(12.06,23.5) 12.06,21.08 13.08,20.07 15.24,20.07 15.62,19.69 15.62,18.42 18.54,15.49 22.35,15.49 22.86,14.99 23.83,14.99 23.84,15 24.5,15 v1(25.02,14.48)
TMC_ENN: length 25.6
  Top Layer w0.18: U11.13 26.46,12.49 v1(25.27,11.3)
  Top Layer w0.254: R14.1 9.27,15.67 9.27,16.13 v2(9.42,16.28) 9.42,16.46 9.44,16.48 9.44,16.69 9.58,16.83 9.58,17.27 9.55,17.3 U12.2
  Bottom Layer w0.18: v1(25.27,11.3) 25.27,13.08 24.51,13.84 20.95,13.84 20.7,14.1 18.16,14.1 14.48,17.78 10.03,17.78 9.42,17.17 v2(9.42,16.28)
U0RXD: length 36.3
  Top Layer w0.2: U11.50 20.07,16.82 19.36,17.53 v1(19.05,17.53)
  Top Layer w0.254: v1(37.97,30.1) 38.55,29.53 NOREF#8.3
  Bottom Layer w0.254: v1(19.05,17.53) 19.05,18.03 19.61,18.59 19.61,22.53 20.95,23.88 20.95,28.58 23.9,31.52 37.19,31.52 37.97,30.73 v1(37.97,30.1)
U0TXD: length 27.9
  Top Layer w0.254: NOREF#4.2 40.76,31.88 v1(38.86,31.88) ; R16.2 19.81,23.42 v1(19.81,23.75)
  Bottom Layer w0.254: v1(38.86,31.88) 23.62,31.88 19.81,28.07 v1(19.81,23.75)
USART_RX: length 1.5
  Top Layer w0.254: U12.14 14.01,21.55 14.1,21.46 R20.2
USB_DN: length 12.7
  Top Layer w0.254: USB1.7 36.96,21.59 37.21,21.34 37.21,20.7 37.1,20.59 USB1.5 34.54,20.59 U3.2 ; 34.53,20.71 34.16,21.08 32.13,21.08 29.47,18.42 U11.25
USB_DP: length 12.1
  Top Layer w0.254: USB1.8 35.19,22.09 35.05,22.23 U4.2 34.53,21.96 ; USB1.6 35.31,21.09 34.53,21.86 34.53,21.96 ; 34.53,21.96 34.04,21.46 31.88,21.46 29.23,18.82 U11.26
VCP: length 3.5
  Top Layer w0.254: U12.6 11.56,17.55 11.56,17.02 12.06,16.51 12.7,16.51 13.33,15.88 C15.2
XTAL_N: length 3.1
  Top Layer w0.2: C25.2 19.35,16.5 X1.3
  Top Layer w0.254: U11.53 19.94,15.62 19.58,15.26 X1.3
XTAL_P: length 8.2
  Top Layer w0.254: U11.54 20.17,15.22 20.07,15.11 20.07,13.97 v2(19.62,13.53) ; X1.1 17.42,14.46 17.14,14.73 C24.2 16.73,13.75 v2(16.89,13.59)
  Bottom Layer w0.254: v2(16.89,13.59) 16.95,13.53 v2(19.62,13.53)
$1N36786: length 2.5
  Top Layer w0.254: USB1.4 34.69,20.09 34.21,19.61 34.21,19.18
$1N36791: length 2.4
  Top Layer w0.254: USB1.10 34.95,23.09 34.42,23.62 R4.2
$1N37821: length 2.9
  Top Layer w0.5: U1.4 23.08,29.43 22.5,28.85 C7.2
$1N38039: length 3.8
  Top Layer w0.5: 30.86,30.52 30.86,31.91 28.52,31.91 U1.6
$1N38048: length 1.6
  Top Layer w0.5: C8.1 31.95,32.44 31.67,32.71 R6.2
$1N38316: length 2.1
  Top Layer w0.5: U1.1 23.08,35.34 22.95,35.47 C1.1
$1N38320: length 16.1
  Top Layer w0.5: D1.1 25.15,36.83 24.76,36.45 C1.2 ; D1.1 27.81,36.83 28.49,36.16 U1.8 ; D1.1 26.38,35.15 24.93,33.7 24.93,27.94
$1N38765: length 4
  Top Layer w0.5: R2.2 30.88,28.75 R1.1 29.03,28.75 28.49,29.3 U1.5
$1N40034: length 4.6
  Top Layer w0.3: R7.1 29.21,9.65 30.03,8.83 LED1.1
$1N40039: length 7
  Top Layer w0.3: LED1.2 29.99,4.7 29.59,4.7 29.11,5.18 29.11,8.59 27.74,9.96 R11.1
$1N40044: length 1.7
  Top Layer w0.3: R13.1 30.99,6.32 LED1.3
$1N40675: length 2.3
  Top Layer w0.254: R12.2 15.42,14.48 15.24,14.48 14.48,13.72 U7.4
$1N42733: length 5.8
  Top Layer w0.2: U11.49 20.37,17.22 19.94,17.65 v2(19.94,17.78)
  Top Layer w0.254: v2(20.32,21.08) 20.19,21.21 R16.1
  Bottom Layer w0.2: v2(19.94,17.78) 19.94,20.7 v2(20.32,21.08)
$1N46706: length 2
  Top Layer w0.254: C23.2 11.01,16.04 10.54,16.51 10.54,16.76 10.55,16.78 U12.4
$1N46710: length 2.2
  Top Layer w0.254: U12.5 11.05,16.89 12.1,15.84 C23.1
$1N47283: length 1.6
  Top Layer w0.254: R21.1 15.48,20.1 U14.2
$1N47663: length 2.3
  Top Layer w0.5: R15.2 10.93,26.68 10.67,26.42 C17.1

## Copper pours and planes (outline as drawn; the poured copper is in the pictures)
+24V on Bottom Layer: 4.83,41.91 0.63,37.72 0.63,14.19 1.88,12.95 14.7,12.95 15.49,13.74 15.49,29.67 20.45,34.63 20.45,41.5 20.03,41.91
GND on Top Layer: 37.34,41.78 41.53,37.59 41.53,5.08 37.08,0.64 5.08,0.64 0.76,4.95 0.76,37.85 4.7,41.78
GND on Bottom Layer: 20.95,41.78 37.34,41.78 41.53,37.59 41.53,5.08 37.08,0.64 5.08,0.64 0.76,4.95 0.76,11.81 1.14,12.19 14.33,12.19 16,13.87 16,29.34 20.75,34.08 20.75,41.53 20.95,41.73

## Text on the board
Bottom Silkscreen Layer: CLMDv1.3 | ENCODER
Top Silkscreen Layer: V+ | CANL | CANH | GND | BOOT | MAX | 3V3 | IO17 | IO18 | IO21 | IO3 | IO36 | IO35 | MIN | RX | TX | LED | RST | 1B | 1A | 2A | 2B | VIN | 5V
